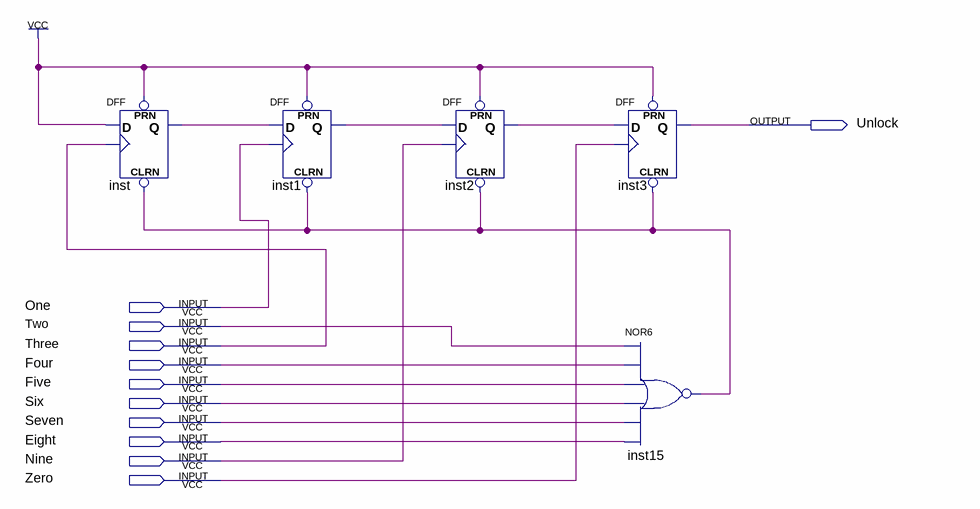
[diagram p0: schematic sheet]
// Quartus schematic Digital_StrongBox.bdf as structural Verilog: 5 symbols, 11 pins
module Digital_StrongBox (
  input  One,
  input  Two,
  input  Three,
  input  Four,
  input  Five,
  input  Six,
  input  Seven,
  input  Eight,
  input  Nine,
  input  Zero,
  output Unlock
);

  wire inst1_q, inst2_q, inst15_out, inst_q;

  DFF inst (.CLRN(inst15_out), .CLK(Three), .D(1'b1), .PRN(1'b1), .Q(inst_q));
  DFF inst1 (.CLRN(inst15_out), .CLK(One), .D(inst_q), .PRN(1'b1), .Q(inst1_q));
  DFF inst2 (.CLRN(inst15_out), .CLK(Nine), .D(inst1_q), .PRN(1'b1), .Q(inst2_q));
  DFF inst3 (.CLRN(inst15_out), .CLK(Zero), .D(inst2_q), .PRN(1'b1), .Q(Unlock));
  nor inst15 (inst15_out, Two, Four, Five, Six, Seven, Eight);
endmodule
